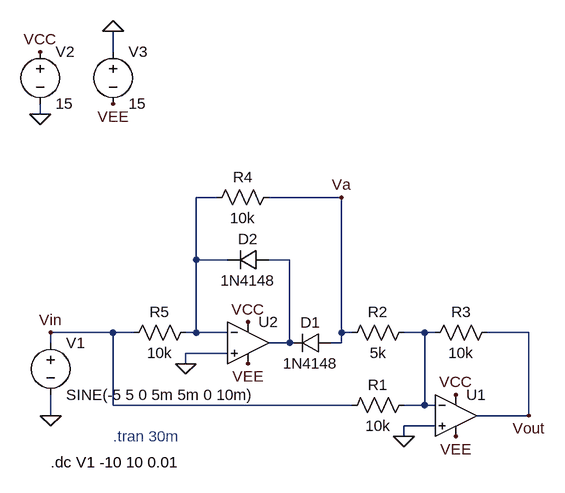
[diagram p0: schematic Draft3.asc]
Draft3.asc, the LTspice schematic file:
Version 4.1
SHEET 1 880 680
WIRE -256 -384 -256 -416
WIRE -368 -288 -368 -304
WIRE -96 -160 -128 -160
WIRE 96 -160 -16 -160
WIRE -128 -64 -128 -160
WIRE -80 -64 -128 -64
WIRE 16 -64 -16 -64
WIRE -256 48 -352 48
WIRE -224 48 -256 48
WIRE -128 48 -128 -64
WIRE -128 48 -144 48
WIRE -80 48 -128 48
WIRE 96 48 96 -160
WIRE 112 48 96 48
WIRE 224 48 192 48
WIRE 240 48 224 48
WIRE 384 48 320 48
WIRE -352 64 -352 48
WIRE 16 64 16 -64
WIRE 16 64 -16 64
WIRE 96 64 96 48
WIRE 96 64 80 64
WIRE -80 80 -144 80
WIRE -144 96 -144 80
WIRE -256 160 -256 48
WIRE 112 160 -256 160
WIRE 224 160 224 48
WIRE 224 160 192 160
WIRE 240 160 224 160
WIRE -352 176 -352 144
WIRE 384 176 384 48
WIRE 384 176 304 176
WIRE 240 192 192 192
WIRE 192 208 192 192
FLAG -144 96 0
FLAG 192 208 0
FLAG -352 176 0
FLAG -48 96 VEE
FLAG 272 208 VEE
FLAG 272 144 VCC
FLAG -48 32 VCC
FLAG -368 -288 0
FLAG -256 -416 0
FLAG -256 -304 VEE
FLAG -368 -384 VCC
FLAG 96 -160 Va
FLAG 384 176 Vout
FLAG -352 48 Vin
SYMBOL OpAmps\\UniversalOpAmp2 272 176 R0
SYMATTR InstName U1
SYMATTR Value2 Avol=1Meg GBW=1.5Meg Slew=500k
SYMATTR SpiceLine Ilimit=25m Rail=1.5 Vos=0
SYMBOL OpAmps\\UniversalOpAmp2 -48 64 R0
SYMATTR InstName U2
SYMATTR Value2 Avol=1Meg GBW=1.5Meg Slew=500k
SYMATTR SpiceLine Ilimit=25m Rail=1.5 Vos=0
SYMBOL res 208 144 R90
WINDOW 0 0 56 VBottom 2
WINDOW 3 32 56 VTop 2
SYMATTR InstName R1
SYMATTR Value 10k
SYMBOL res 208 32 R90
WINDOW 0 0 56 VBottom 2
WINDOW 3 32 56 VTop 2
SYMATTR InstName R2
SYMATTR Value 5k
SYMBOL res 336 32 R90
WINDOW 0 0 56 VBottom 2
WINDOW 3 32 56 VTop 2
SYMATTR InstName R3
SYMATTR Value 10k
SYMBOL diode 80 80 M270
WINDOW 0 32 32 VTop 2
WINDOW 3 0 32 VBottom 2
SYMATTR InstName D1
SYMATTR Value 1N4148
SYMBOL diode -16 -48 M270
WINDOW 0 32 32 VTop 2
WINDOW 3 0 32 VBottom 2
SYMATTR InstName D2
SYMATTR Value 1N4148
SYMBOL res 0 -176 R90
WINDOW 0 0 56 VBottom 2
WINDOW 3 32 56 VTop 2
SYMATTR InstName R4
SYMATTR Value 10k
SYMBOL res -128 32 R90
WINDOW 0 0 56 VBottom 2
WINDOW 3 32 56 VTop 2
SYMATTR InstName R5
SYMATTR Value 10k
SYMBOL voltage -352 48 R0
WINDOW 123 0 0 Left 0
WINDOW 39 0 0 Left 0
SYMATTR InstName V1
SYMATTR Value SINE(-5 5 0 5m 5m 0 10m)
SYMBOL voltage -368 -400 R0
WINDOW 123 0 0 Left 0
WINDOW 39 0 0 Left 0
SYMATTR InstName V2
SYMATTR Value 15
SYMBOL voltage -256 -400 R0
WINDOW 123 0 0 Left 0
WINDOW 39 0 0 Left 0
SYMATTR InstName V3
SYMATTR Value 15
TEXT -352 248 Left 2 !.dc V1 -10 10 0.01
TEXT -256 208 Left 2 ;.tran 30m

The netlist it stands for:
* Draft3.asc
X§U1 0 N003 VCC VEE Vout level2 Avol=1Meg GBW=1.5Meg Slew=500k Ilimit=25m Rail=1.5 Vos=0 En=0 Enk=0 In=0 Ink=0 Rin=500Meg  ; pins In+ In- V+ V- OUT
X§U2 0 N001 VCC VEE N002 level2 Avol=1Meg GBW=1.5Meg Slew=500k Ilimit=25m Rail=1.5 Vos=0 En=0 Enk=0 In=0 Ink=0 Rin=500Meg  ; pins In+ In- V+ V- OUT
R1 N003 Vin 10k
R2 N003 Va 5k
R3 Vout N003 10k
D1 Va N002 1N4148
D2 N002 N001 1N4148
R4 Va N001 10k
R5 N001 Vin 10k
V1 Vin 0 SINE(-5 5 0 5m 5m 0 10m)
V2 VCC 0 15
V3 0 VEE 15
.model D D
.lib standard.dio
.dc V1 -10 10 0.01
* .tran 30m
.lib UniversalOpAmp2.lib
.backanno
.end